# Altium schematic sheet ETH.SchDoc: PERIPHERA
size A4; Revision: V2.0; SheetNumber: 5; SheetTotal: 7; Project: PY32F403v1xT_START
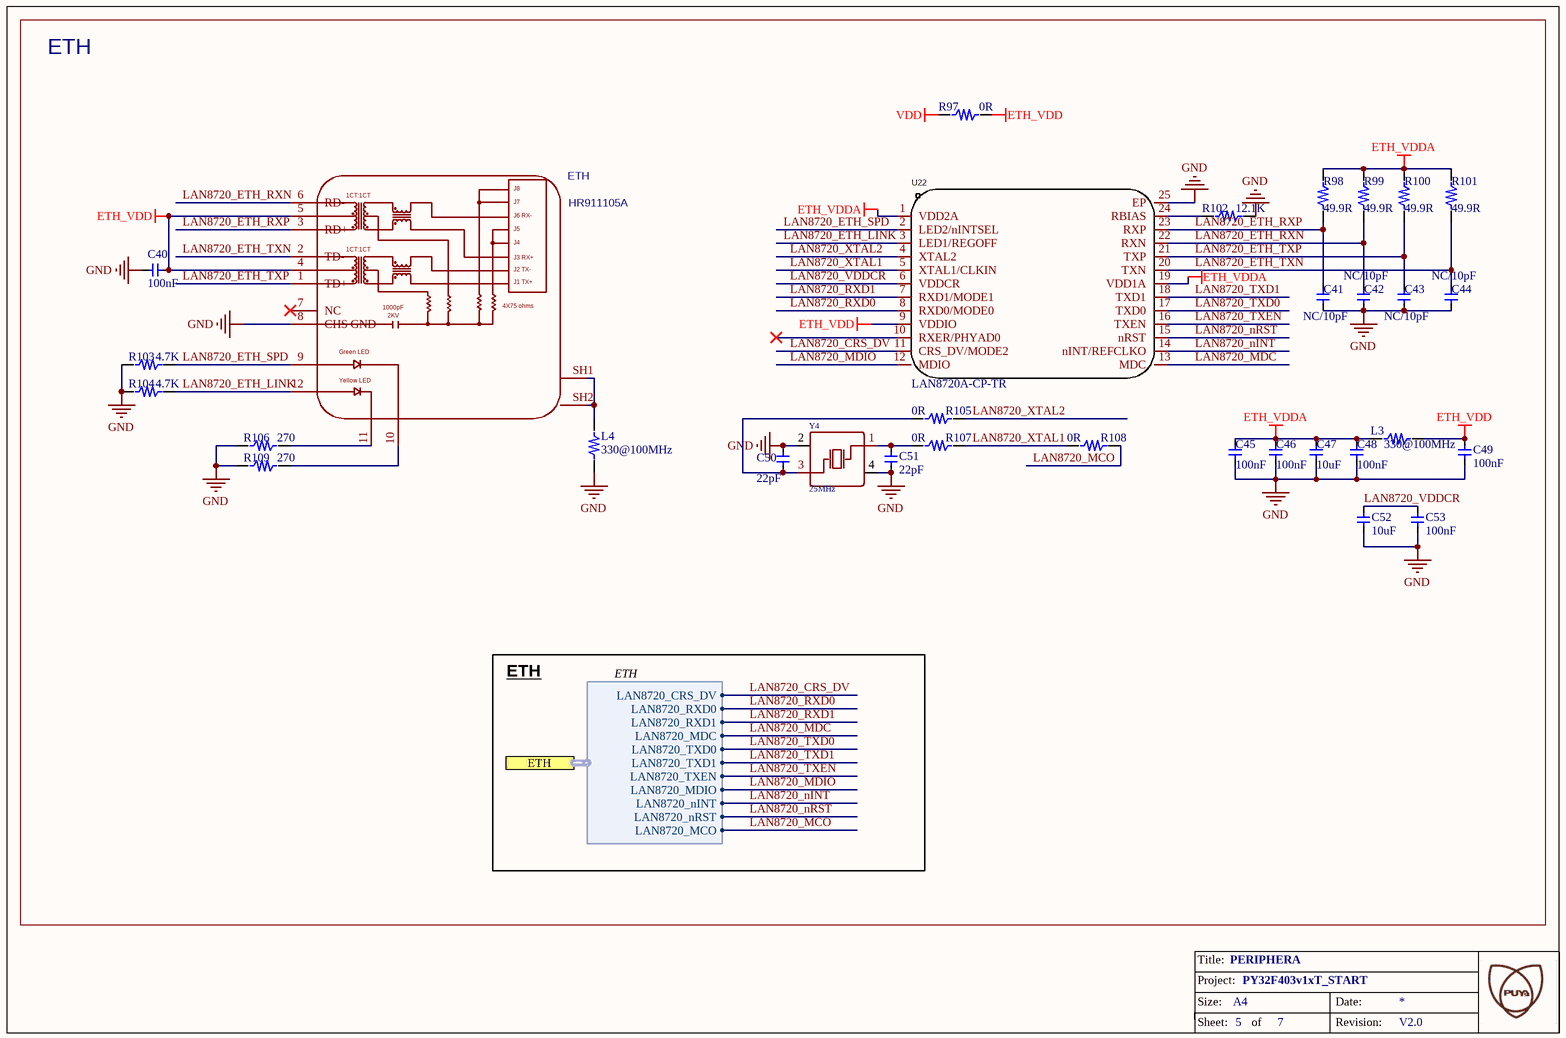
[diagram p0: ETH.SchDoc]

## Parts
C40  100nF  [C0603]
C41  NC/10pF  [C0603]
C42  NC/10pF  [C0603]
C43  NC/10pF  [C0603]
C44  NC/10pF  [C0603]
C45  100nF  [C0603]
C46  100nF  [C0603]
C47  10uF  [C0603]
C48  100nF  [C0603]
C49  100nF  [C0603]
C50  22pF  [C0603]
C51  22pF  [C0603]
C52  10uF  [C0603]
C53  100nF  [C0603]
ETH  HR911105A  [RJ45-TH_HR911105A]
L3  330@100MHz  [R0603]
L4  330@100MHz  [R0603]
R97  0R  [RES0603]
R98  49.9R  [R0603]
R99  49.9R  [R0603]
R100  49.9R  [R0603]
R101  49.9R  [R0603]
R102  12.1K  [R0603]
R103  4.7K  [R0603]
R104  4.7K  [R0603]
R105  0R  [R0603]
R106  270  [R0603]
R107  0R  [R0603]
R108  0R  [R0603]
R109  270  [R0603]
U22  LAN8720A-CP-TR  [QFN-24_L4.0-W4.0-P0.50-BL-EP2.6]
Y4  25MHz  [SMD-3225_4P]

## Ports
ETH (harness ETH)

## Harnesses
ETH: LAN8720_TXD0, LAN8720_MDC, LAN8720_RXD1, LAN8720_CRS_DV, LAN8720_TXD1, LAN8720_TXEN, LAN8720_nINT, LAN8720_MDIO, LAN8720_nRST, LAN8720_RXD0, LAN8720_MCO

## Nets
ETH_VDD: C40.2 C49.2 ETH.4 ETH.5 L3.2 R97.2 U22.9(VDDIO)
ETH_VDDA: C45.2 C46.2 C47.2 C48.2 L3.1 R98.2 R99.2 R100.2 R101.2 U22.1(VDD2A) U22.19(VDD1A)
GND: C40.1 C41.1 C42.1 C43.1 C44.1 C45.1 C46.1 C47.1 C48.1 C49.1 C50.2 C51.1 C52.1 C53.1 ETH.8(CHS_GND) L4.1 R102.2 R103.1 R104.1 R106.1 R109.1 U22.25(EP) Y4.2(GND) Y4.4(GND)
VDD: R97.1
LAN8720_CRS_DV: U22.11(CRS_DV/MODE2) ; port ETH.LAN8720_CRS_DV
LAN8720_ETH_LINK: ETH.12 R104.2 U22.3(LED1/REGOFF)
LAN8720_ETH_RXN: C42.2 ETH.6(RD-) R99.1 U22.22(RXN)
LAN8720_ETH_RXP: C41.2 ETH.3(RD+) R98.1 U22.23(RXP)
LAN8720_ETH_SPD: ETH.9 R103.2 U22.2(LED2/nINTSEL)
LAN8720_ETH_TXN: C44.2 ETH.2(TD-) R101.1 U22.20(TXN)
LAN8720_ETH_TXP: C43.2 ETH.1(TD+) R100.1 U22.21(TXP)
LAN8720_MCO: R108.2 ; port ETH.LAN8720_MCO
LAN8720_MDC: U22.13(MDC) ; port ETH.LAN8720_MDC
LAN8720_MDIO: U22.12(MDIO) ; port ETH.LAN8720_MDIO
LAN8720_nINT: U22.14(nINT/REFCLKO) ; port ETH.LAN8720_nINT
LAN8720_nRST: U22.15(nRST) ; port ETH.LAN8720_nRST
LAN8720_RXD0: U22.8(RXD0/MODE0) ; port ETH.LAN8720_RXD0
LAN8720_RXD1: U22.7(RXD1/MODE1) ; port ETH.LAN8720_RXD1
LAN8720_TXD0: U22.17(TXD0) ; port ETH.LAN8720_TXD0
LAN8720_TXD1: U22.18(TXD1) ; port ETH.LAN8720_TXD1
LAN8720_TXEN: U22.16(TXEN) ; port ETH.LAN8720_TXEN
LAN8720_VDDCR: C52.2 C53.2 U22.6(VDDCR)
LAN8720_XTAL1: R107.2 R108.1 U22.5(XTAL1/CLKIN)
LAN8720_XTAL2: R105.2 U22.4(XTAL2)
NetC50_1: C50.1 R105.1 Y4.3(OSC2)
NetC51_2: C51.2 R107.1 Y4.1(OSC1)
NetETH_10: ETH.10 R109.2
NetETH_11: ETH.11 R106.2
NetETH_SH1: ETH.SH1 ETH.SH2 L4.2
NetR102_1: R102.1 U22.24(RBIAS)

Not connected (* = marked no-connect by the designer): ETH 7(NC)*; U22 10(RXER/PHYAD0)*

## Notes on the sheet
- ETH
- Title:
- Project:
- Size:
- Sheet:
- A4
- of
- Date:
- Revision:
- (in symbol HR911105A_C12074) J8; 1CT:1CT; J7; J6 RX-; J5; J4; J3 RX+; J2 TX-; J1 TX+; 1000pF; 4X75 ohms; 2KV; Green LED; Yellow LED

## Library data of the parts
C40-C53 = C0603: PCB DECAL: 0603
ETH = HR911105A_C12074: Manufacturer: HANRUN; Contributor: 13471635540; Supplier: LCSC; Manufacturer Part: HR911105A; image: //image.lceda.cn/szlcsc/C12074.jpg; Supplier Part: C12074; spicePre: J; spiceSymbolName: HR911105A_C12074
L3 L4 R98-R109 = R0603: PCB DECAL: 0603
R97 = R0805: PCB DECAL: 0805
U22 = LAN8720A-CP-TR: 立创 C45223; Manufacturer: MICROCHIP(美国微芯); Add into BOM: yes; Application Function: 以太网收发器; Number of Channels: 1; Interface: RMII; Supply Voltage: 1.6V~3.6V; Name: LAN8720A-CP-TR; Symbol: LAN8720A-CP-TR; Device: LAN8720A-CP-TR; LCSC Part Name: LAN8720A-CP-TR; Supplier Part: C45223; Manufacturer Part: LAN8720A-CP-TR; Supplier Footprint: QFN-24-EP(4x4); JLCPCB Part Class: Extended Part; Datasheet: https://atta.szlcsc.com/upload/public/pdf/source/20151012/1457707444106.pdf; Supplier: LCSC; Convert to PCB: yes; Operating Temperature: 0℃~+85℃
Y4 = 12MHz: BOM_Manufacturer: TAE; BOM_Manufacturer Part: SMD-3225_4P12M20pf10ppm; nameAlias: Frequency; Contributor: LCSC; SMT Type: Extend; BOM_Supplier: LCSC; BOM_Supplier Part: C133334; BOM_LCSC Assembly: Yes; spicePre: X; spiceSymbolName: SMD-3225_4P12M20PF10PPM